# Altium schematic sheet Top.SchDoc
size A4
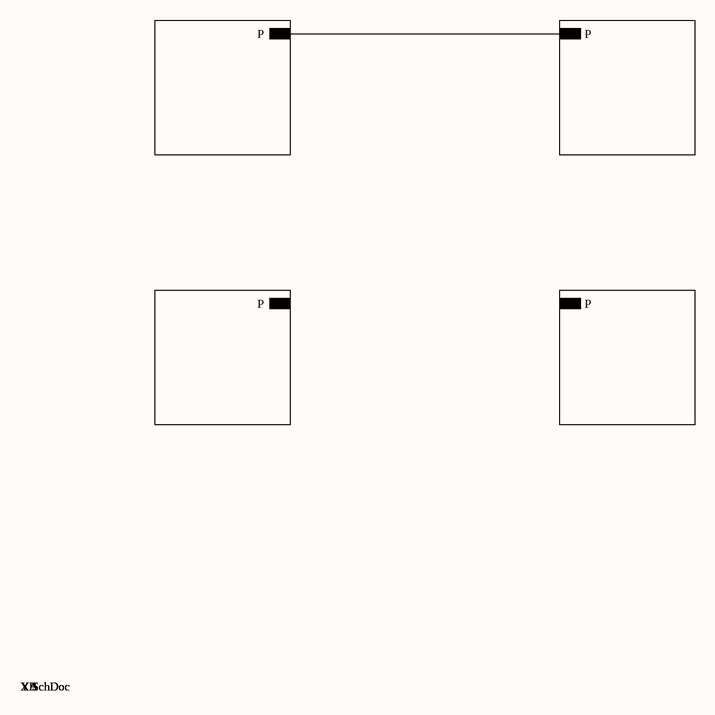
[diagram p0: Top.SchDoc]

## Sub-sheets
XA = X.SchDoc: P
XB = X.SchDoc: P
YA = Y.SchDoc: P
YB = Y.SchDoc: P

## Nets
(unnamed): sheet XA/P, sheet YA/P